# Altium schematic sheet 10_20_MCU_CORE.SchDoc
size 289 x 397 mm
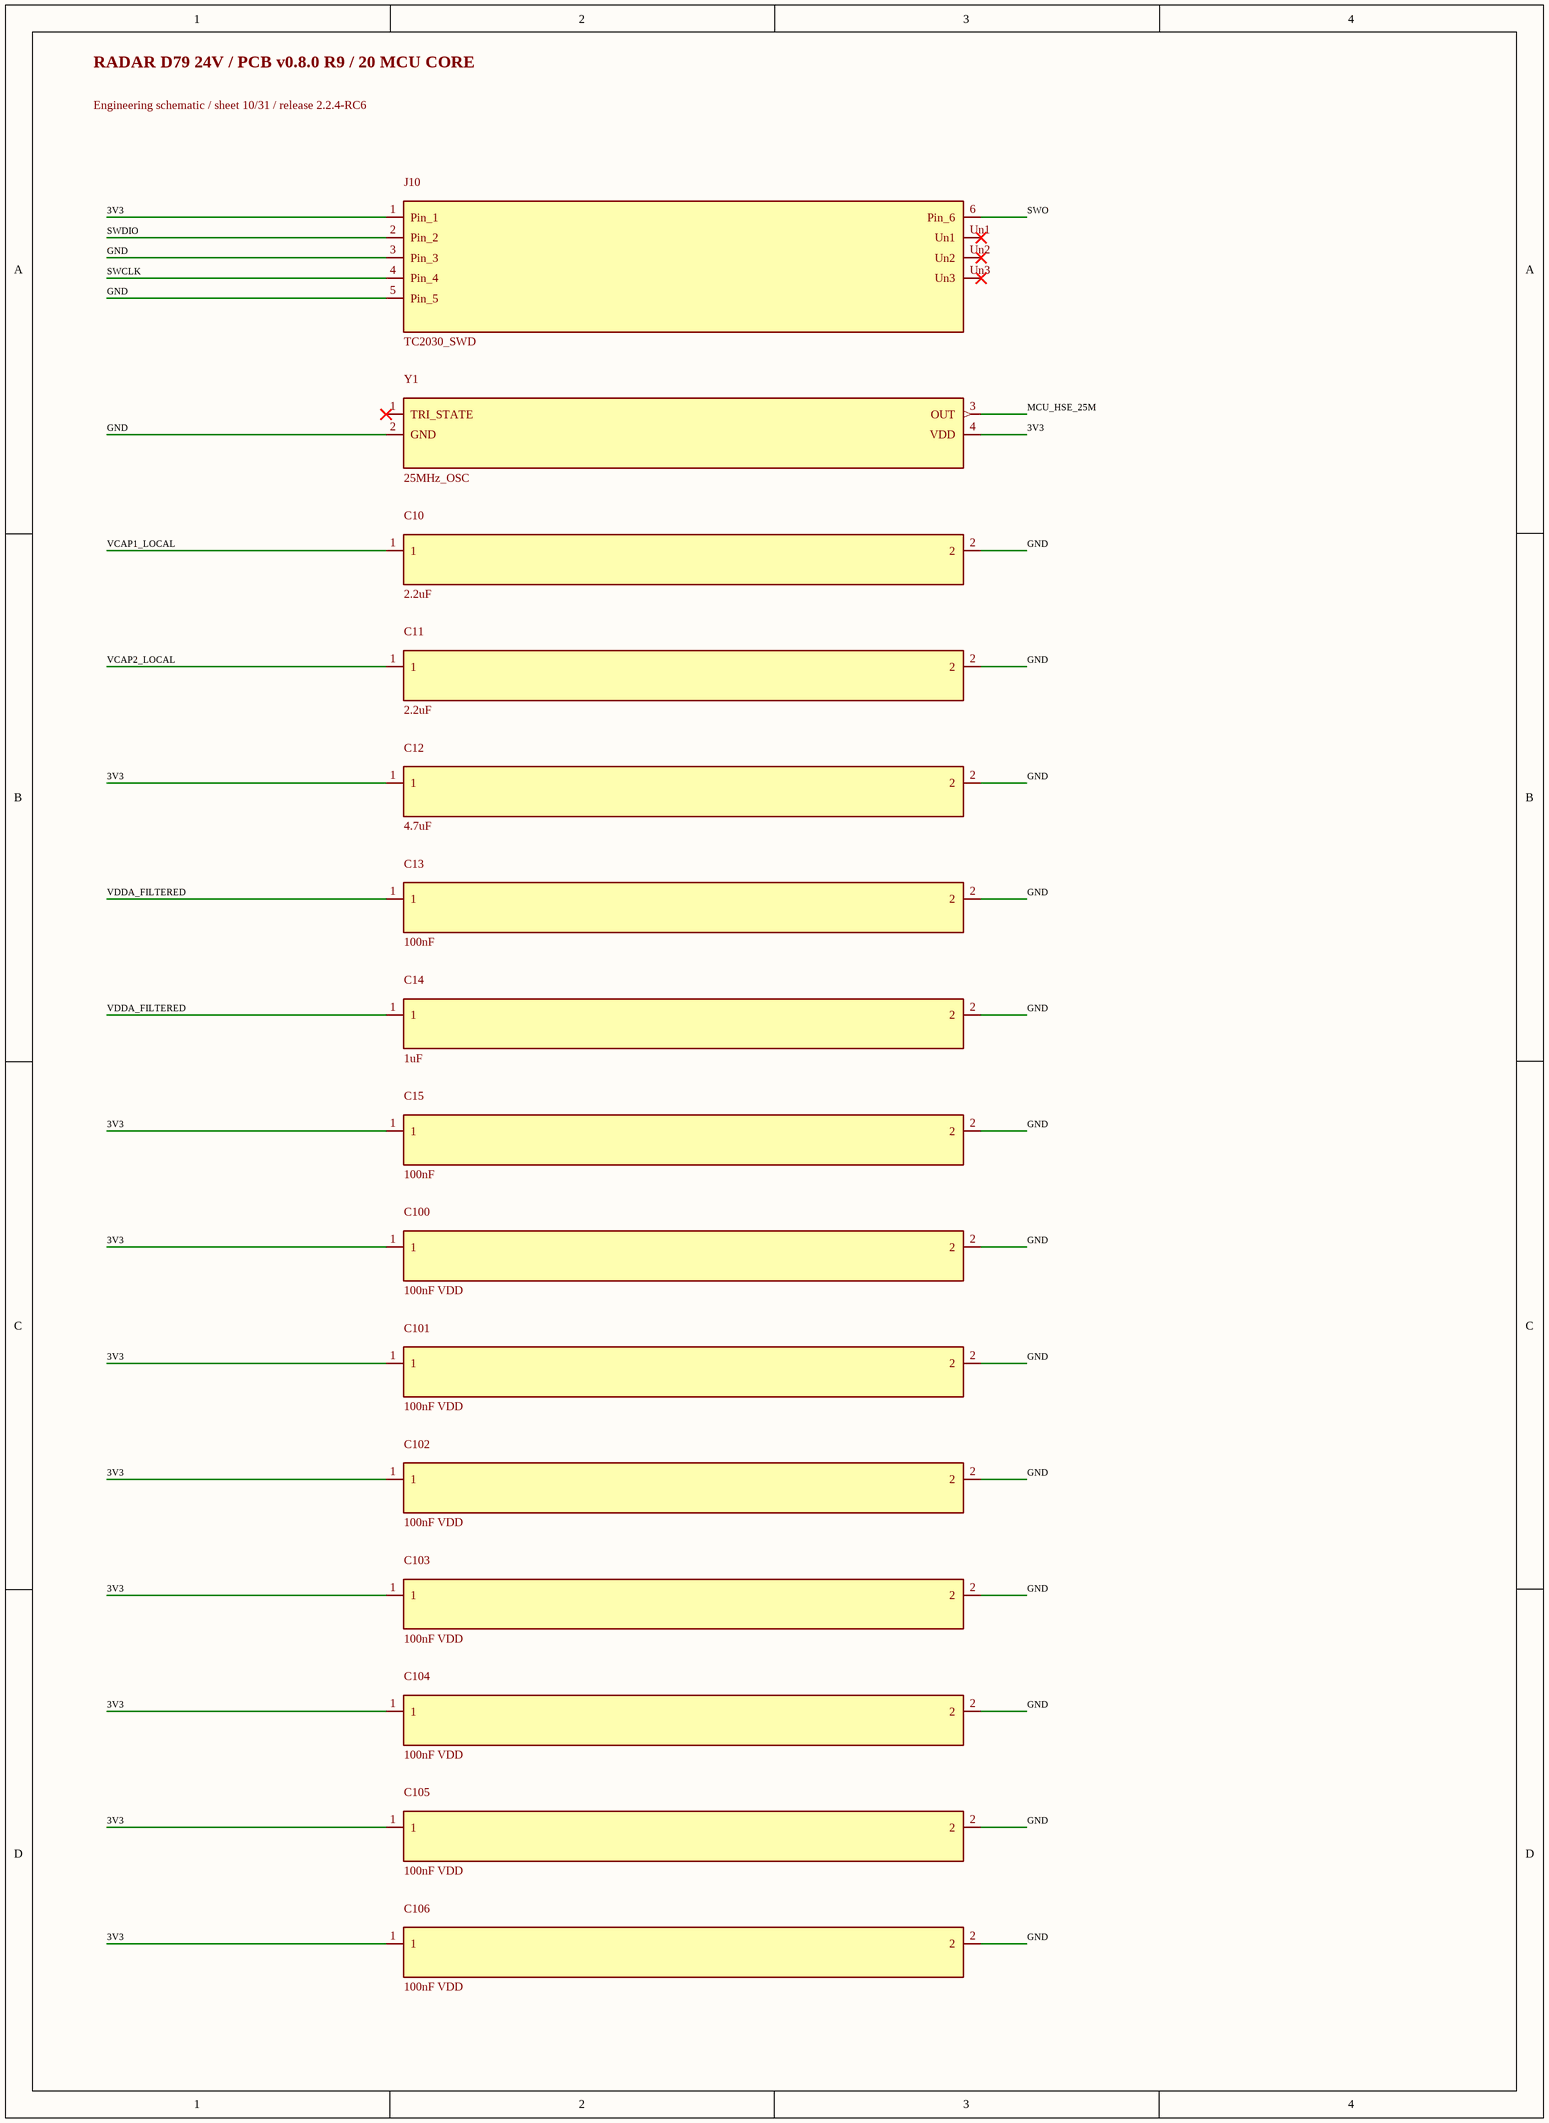
[diagram p0: 10_20_MCU_CORE.SchDoc]

## Parts
C10  2.2uF  [C_0603_1608Metric]
C11  2.2uF  [C_0603_1608Metric]
C12  4.7uF  [C_0805_2012Metric]
C13  100nF  [C_0402_1005Metric]
C14  1uF  [C_0603_1608Metric]
C15  100nF  [C_0402_1005Metric]
C100  100nF VDD  [C_0402_1005Metric]
C101  100nF VDD  [C_0402_1005Metric]
C102  100nF VDD  [C_0402_1005Metric]
C103  100nF VDD  [C_0402_1005Metric]
C104  100nF VDD  [C_0402_1005Metric]
C105  100nF VDD  [C_0402_1005Metric]
C106  100nF VDD  [C_0402_1005Metric]
J10  TC2030_SWD  [TagConnect_TC2030_NL]
Y1  25MHz_OSC  [Oscillator_SMD_ECS_2520MV-xxx-xx-4Pin_2.5x2.0mm]

## Nets
3V3: C12.1 C15.1 C100.1 C101.1 C102.1 C103.1 C104.1 C105.1 C106.1 J10.1(Pin_1) Y1.4(VDD)
GND: C10.2 C11.2 C12.2 C13.2 C14.2 C15.2 C100.2 C101.2 C102.2 C103.2 C104.2 C105.2 C106.2 J10.3(Pin_3) J10.5(Pin_5) Y1.2(GND)
MCU_HSE_25M: Y1.3(OUT)
SWCLK: J10.4(Pin_4)
SWDIO: J10.2(Pin_2)
SWO: J10.6(Pin_6)
VCAP1_LOCAL: C10.1
VCAP2_LOCAL: C11.1
VDDA_FILTERED: C13.1 C14.1

Not connected (* = marked no-connect by the designer): J10 Un1* Un2* Un3*; Y1 1(TRI_STATE)*

## Notes on the sheet
- RADAR D79 24V / PCB v0.8.0 R9 / 20 MCU CORE
- Engineering schematic / sheet 10/31 / release 2.2.4-RC6